# EasyEDA Pro project 电脑鼠_数字量最终方案.eprj, schematic 底盘
Create Date: 2025-09-23; Page Name: P1; Project Name: 电脑鼠SYR; Schematic Name: 底盘; Update Date: 2025-10-16; Company: 苏州大学电子信息学院; Drawed: 石殷睿; Page Size: A4; Version: V1.0
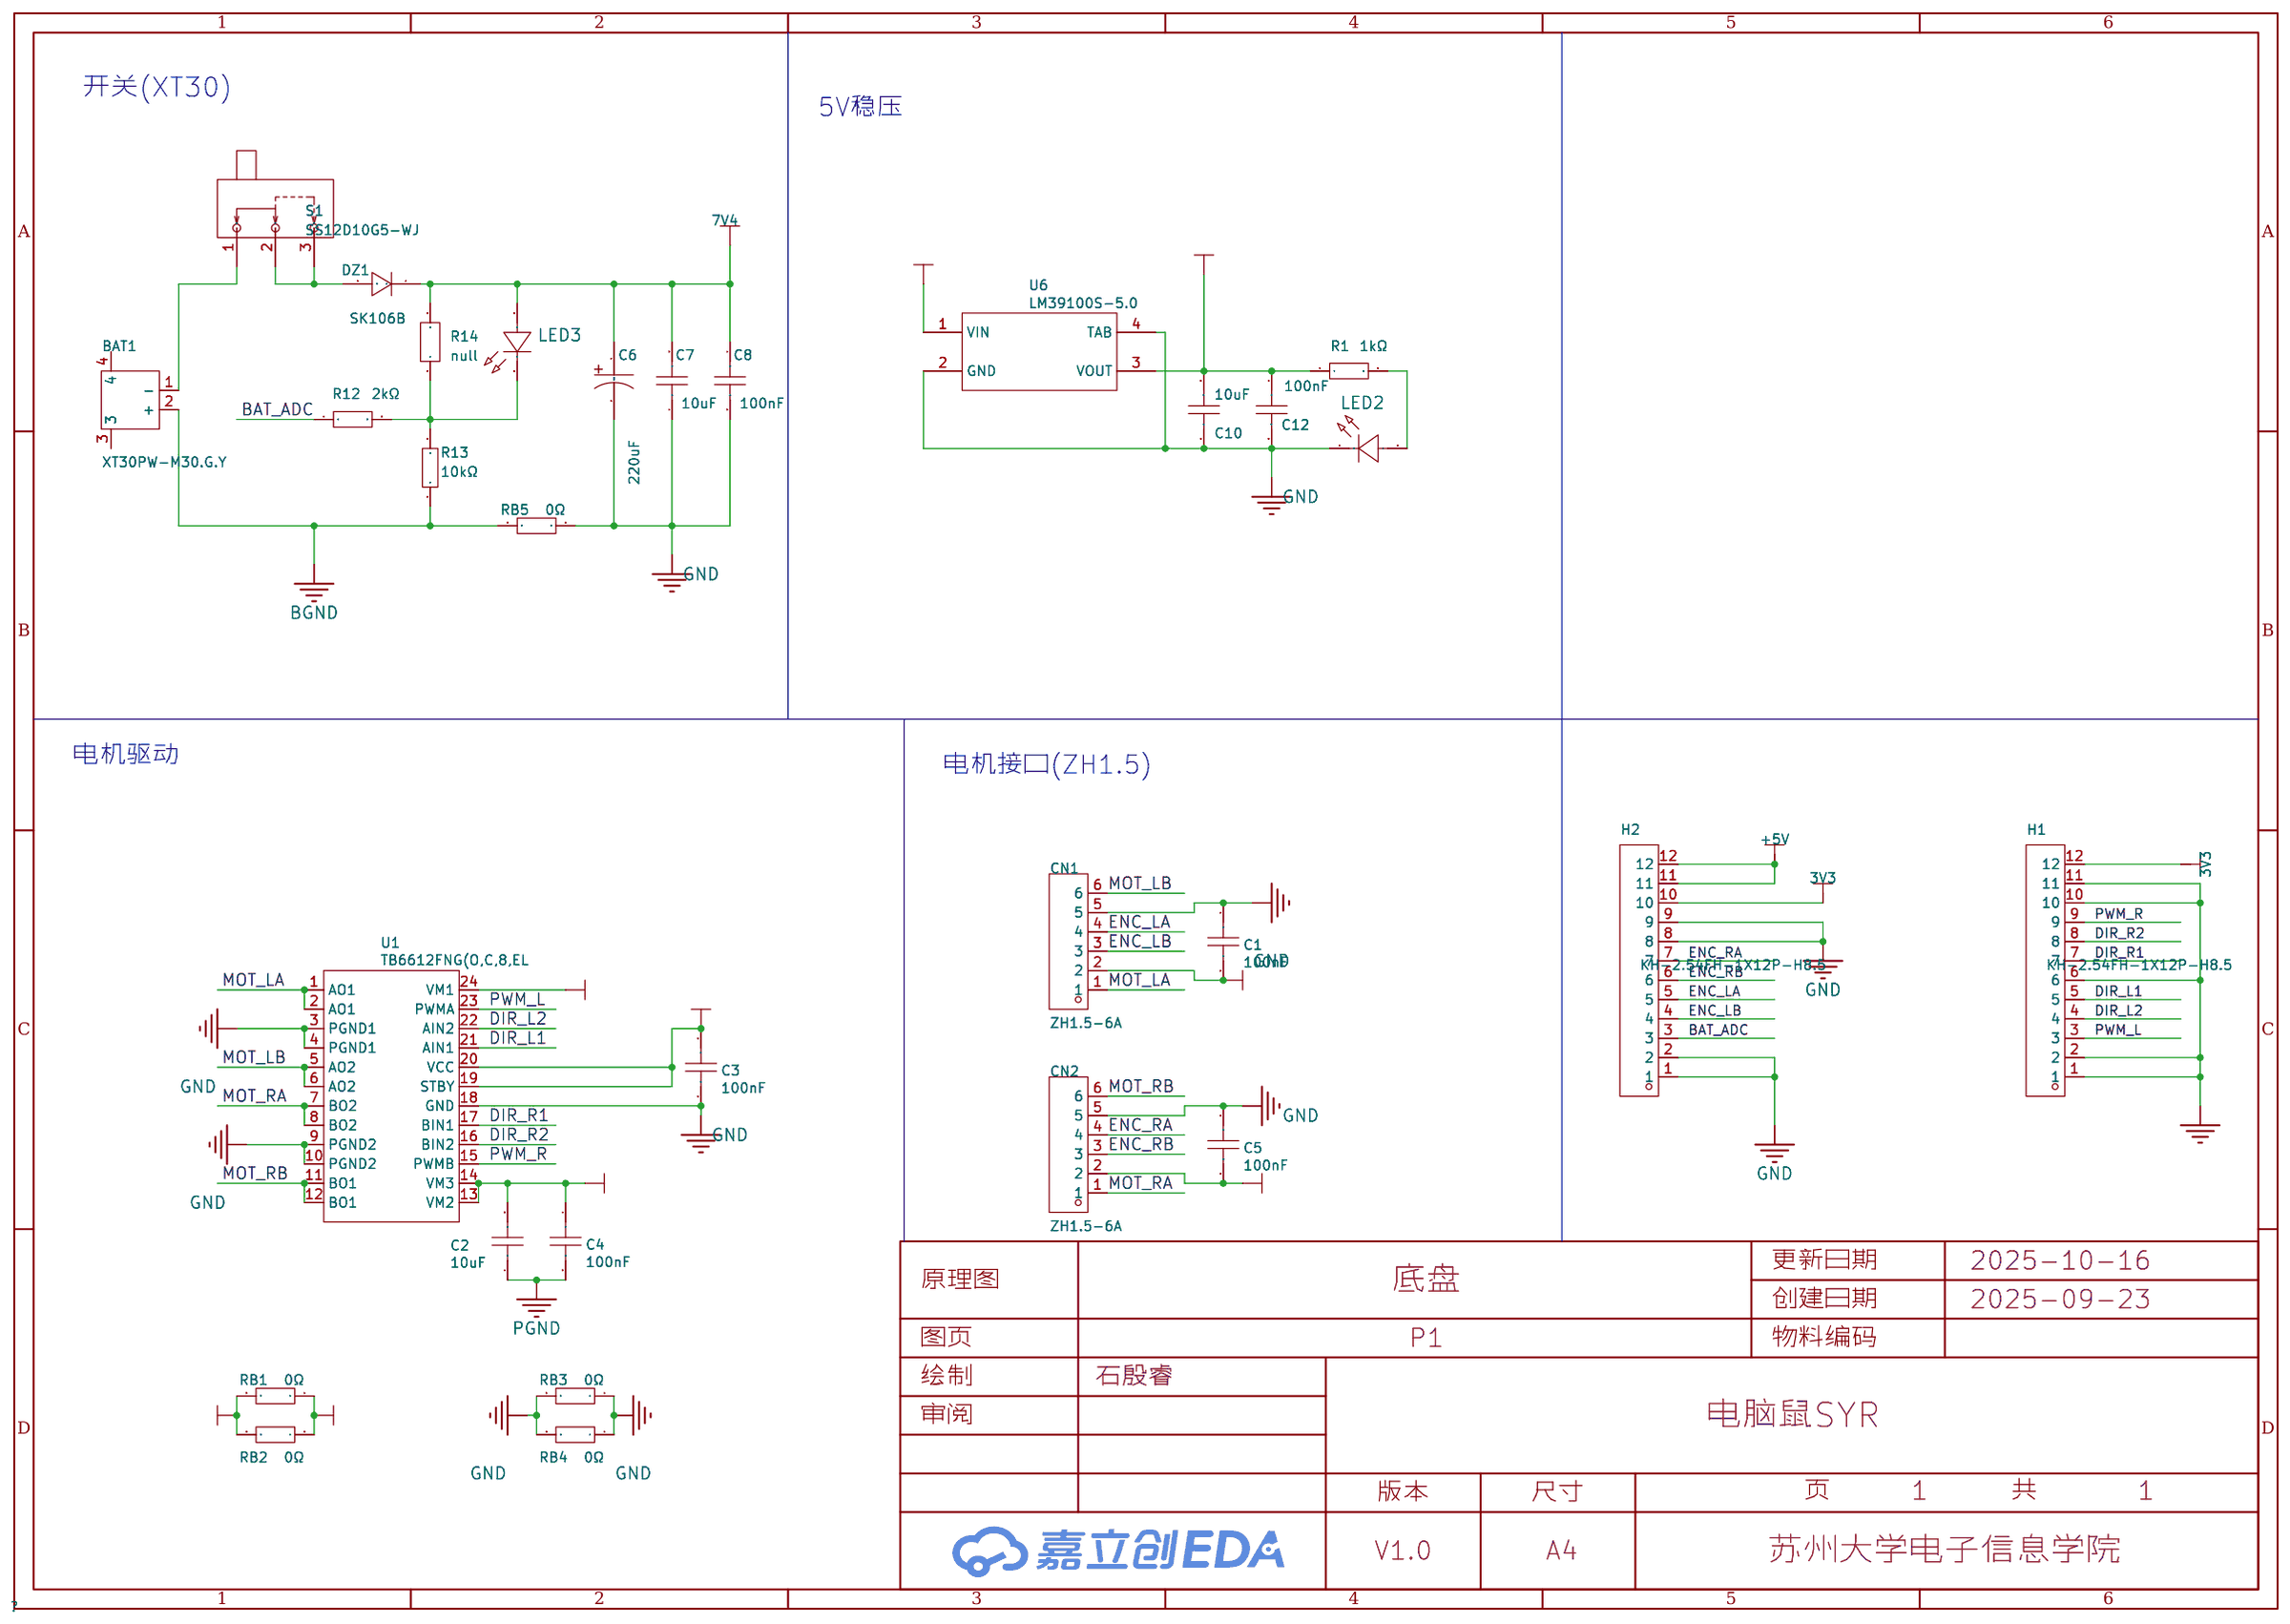
[diagram p1: schematic sheet]

## Parts
BAT1  XT30PW-M30.G.Y  [CONN-TH_XT30PW-M]
C1  100nF  [C0603]
C2  10uF  [C1206]
C3  100nF  [C0603]
C4  100nF  [C0603]
C5  100nF  [C0603]
C6  220uF  [CAP-TH_BD8.0-P3.50-D0.6-FD]
C7  10uF  [C1206]
C8  100nF  [C0603]
C10  10uF  [C1206]
C12  100nF  [C0603]
CN1  ZH1.5-6A  [CONN-TH_ZH1.5-6A]
CN2  ZH1.5-6A  [CONN-TH_ZH1.5-6A]
DZ1  SK106B  [SMB_L4.5-W3.7-LS5.4-RD]
H1  KH-2.54FH-1X12P-H8.5  [HDR-TH_12P-P2.54-V-F]
H2  KH-2.54FH-1X12P-H8.5  [HDR-TH_12P-P2.54-V-F]
LED2  XL-1608SURC-06  [LED0603-RD_RED]
LED3  XL-1608SURC-06  [LED0603-RD_RED]
R1  1kΩ  [R0603]
R12  2kΩ  [R0603]
R13  10kΩ  [R0603]
R14  null  [R0603]
RB1  0Ω  [R0603]
RB2  0Ω  [R0603]
RB3  0Ω  [R0603]
RB4  0Ω  [R0603]
RB5  0Ω  [R0603]
S1  SS12D10G5-WJ  [SW-TH_3P-SS12D06-1]
U1  TB6612FNG(O,C,8,EL  [SSOP-24_L8.4-W5.8-P0.65-LS7.8-BL]
U6  LM39100S-5.0  [SOT-223-3_L6.5-W3.4-P2.30-LS7.0-BR]

## Library data of the parts
BAT1 = XT30PW-M30.G.Y: 类别:-;类型1:-;; LCSC Part Name: AMASS(艾迈斯)航模插头 卧式弯脚 XT30PW-M公头; Supplier Part: C431092; Manufacturer: AMASS(艾迈斯); JLCPCB Part Class: Extended Part; Datasheet: https://item.szlcsc.com/datasheet/XT30PW-M30.G.Y/426930.html; Supplier: LCSC; Type: 航模插头; RatedVoltage: DC 500V; InterfaceType: 公头; RatedCurrent: 15A; RecommendedWireGauge: 16/18/20AWG; contact resistance: 1.2mΩ; specifications: 2pin
C1 C3-C5 C8 C12 = CC0603KRX7R9BB104: 容值:100nF;精度:±10%;额定电压:50V;温度系数:X7R;; LCSC Part Name: 100nF ±10% 50V; Supplier Part: C14663; Manufacturer: YAGEO(国巨); Supplier Footprint: 0603; JLCPCB Part Class: Basic Part; Datasheet: https://item.szlcsc.com/datasheet/CC0603KRX7R9BB104/15331.html; Supplier: LCSC; Tolerance: ±10%; Voltage Rated: 50V; Temperature Coefficient: X7R; Voltage Rating: 50V
C2 C7 C10 = CL31A106KBHNNNE: 容值:10uF;精度:±10%;额定电压:50V;温度系数:X5R;; LCSC Part Name: 10uF ±10% 50V; Supplier Part: C13585; Manufacturer: SAMSUNG(三星); Supplier Footprint: 1206; JLCPCB Part Class: Basic Part; Datasheet: https://item.szlcsc.com/datasheet/CL31A106KBHNNNE/14236.html; Supplier: LCSC; Tolerance: ±10%; Voltage Rating: 50V; Temperature Coefficient: X5R; link: https://so.szlcsc.com/global.html?k=C3897871&amp;ref=editor
C6 = GR227M025F12RR0VH4FP0: 容值:220uF;精度:±20%;额定电压:25V;; LCSC Part Name: 220uF ±20% 25V; Supplier Part: C114911; Manufacturer: Chengx(承兴); Supplier Footprint: 插件,D8xL12mm; JLCPCB Part Class: Extended Part; Datasheet: https://item.szlcsc.com/datasheet/GR227M025F12RR0VH4FP0/116155.html; Supplier: LCSC; Tolerance: ±20%; Rated Voltage: 25V; Lead Spacing: 3.5mm; φD: 8mm; L: 12mm; Operating Temperature: -40℃~+105℃; Voltage Rating: 25V; Pin Spacing: 3.5mm; Diameter: 8mm; Height - Seated (Max): 12mm
CN1 CN2 = ZH1.5-6A: 插针结构:1x6P;间距:1.5mm;安装方式:直插;参考系列:ZH;总PIN数:6P;排数:1;每排PIN数:6;行距:-;额定电流:1A;工作温度:-25℃~+85℃;; LCSC Part Name: 1x6P 间距:1.5mm 直插 系列:ZH; Supplier Part: C722926; Manufacturer: CAX(创都); Supplier Footprint: 插件,P=1.5mm; JLCPCB Part Class: Extended Part; Datasheet: https://item.szlcsc.com/datasheet/ZH1.5-6A/767133.html; Supplier: LCSC; Pins Structure: 1x6P; Pitch: 1.5mm; Mounting Style: 直插; Reference Series: ZH; Number of Pins: 6P; Number of Rows: 1; Number of PINs Per Row: 6; Current Rating (Max): 1A; Operating Temperature Range: -25℃~+85℃; Mounting Type: 直插; Current Rating: 1A; Operating Temperature: -25℃~+85℃
DZ1 = SK106B_C28646301: 二极管配置:独立式;正向压降(Vf):700mV@10A;直流反向耐压(Vr):60V;整流电流:10A;; LCSC Part Name: 电压:60V 电流:10A; Supplier Part: C28646301; Manufacturer: R+O(宏嘉诚); Supplier Footprint: SMB; JLCPCB Part Class: Extended Part; Datasheet: https://item.szlcsc.com/datasheet/SK106B/30381047.html; Supplier: LCSC; Diode Configuration: 独立式; Voltage - Forward(Vf@If): 700mV@10A; Voltage - DC Reverse(Vr): 60V; Current - Rectified: 10A; Reverse Leakage Current (Ir): 100uA@60V; Forward Voltage (Vf@If): 650mV@10A; Reverse Voltage (Vr): 60V; Rectified Current: 10A
H1 H2 = KH-2.54FH-1X12P-H8.5: 插孔结构:1x12P;间距:2.54mm;行距:-;圆孔/方孔:方孔;安装方式:直插;排数:单排;总孔位数:12P;额定电流:3A;额定电压:-;插孔方向:顶部;塑高:8.5mm;工作温度:-40℃~+105℃;; LCSC Part Name: 间距:2.54mm 1x12P 直插; Supplier Part: C2905419; Manufacturer: kinghelm(金航标); Supplier Footprint: 插件,P=2.54mm; JLCPCB Part Class: Extended Part; Datasheet: https://item.szlcsc.com/datasheet/KH-2.54FH-1X12P-H8.5/3175193.html; Supplier: LCSC; Holes Structure: 1x12P; Pitch: 2.54mm; Circular Hole / Square Hole: 方孔; Mounting Type: 直插; Number of Rows: 单排; Number of Holes: 12P; Current Rating (Max): 3A; Holes Direction: 顶部; Insulation Height: 8.5mm; Operating Temperature Range: -40℃~+105℃; Number of Positions: 12P; Current Rating: 3A; Operating Temperature: -40℃~+105℃
LED2 LED3 = XL-1608SURC-06: 灯头类型:-;发光颜色:红色;正向压降(Vf):2.3V;功率:50mW;正向电流:20mA;波长:620nm~630nm;二极管配置:-;透镜颜色:无色透明透镜;色温:-;发光强度:225mcd;发光角度:120°;载带方式:正贴;工作温度:-40℃~+85℃;; LCSC Part Name: 0603红色贴片式发光二极管; Supplier Part: C965799; Manufacturer: XINGLIGHT(成兴光); Supplier Footprint: 0603; JLCPCB Part Class: Extended Part; Datasheet: https://item.szlcsc.com/datasheet/XL-1608SURC-06/1051408.html; Supplier: LCSC; Emitted Color: 红色; Power Dissipation: 55mW; Forward Current: 20mA; Dominant Wavelength: 617nm~621nm; Peak Wavelength: 625nm; Lens Color: 无色透明透镜; Viewing Angle: 120°; Mounting Sytle: 正贴; Operating Temperature: -40℃~+85℃; Illumination Color: 红色; Voltage - Forward(Vf): 2.3V; Power(Watts): 50mW; Wavelength - Dominant: 620nm~630nm; Luminous Intensity: 225mcd; Mounting Style: 正贴
R1 = 0603WAF1001T5E: 电阻类型:厚膜电阻;阻值:1kΩ;精度:±1%;功率:100mW;最大工作电压:75V;温度系数:±100ppm/℃;; LCSC Part Name: 1kΩ ±1% 100mW 厚膜电阻; Supplier Part: C21190; Manufacturer: UNI-ROYAL(厚声); Supplier Footprint: 0603; JLCPCB Part Class: Basic Part; Datasheet: https://atta.szlcsc.com/upload/public/pdf/source/20200306/C422600_1E6D84923E4A46A82E41ADD87F860B5C.pdf; Supplier: LCSC; Type: 厚膜电阻; Tolerance: ±1%; Power(Watts): 100mW; Overload Voltage (Max): 75V; Temperature Coefficient: ±100ppm/℃; Operating Temperature Range: -55℃~+155℃
R12 = 0603WAF2001T5E: 电阻类型:厚膜电阻;阻值:2kΩ;精度:±1%;功率:100mW;工作电压:75V;温度系数:±100ppm/℃;; LCSC Part Name: 2kΩ ±1% 100mW 厚膜电阻; Supplier Part: C22975; Manufacturer: UNI-ROYAL(厚声); Supplier Footprint: 0603; JLCPCB Part Class: Basic Part; Datasheet: https://item.szlcsc.com/datasheet/0603WAF2001T5E/23702.html; Supplier: LCSC; Type: 厚膜电阻; Tolerance: ±1%; Power(Watts): 100mW; Overload Voltage (Max): 75V; Temperature Coefficient: ±100ppm/℃; Operating Temperature Range: -55℃~+155℃; Voltage-Supply(Max): 75V; Operating Temperature: -55℃~+155℃
R13 = 0603WAF1002T5E: 电阻类型:厚膜电阻;阻值:10kΩ;精度:±1%;功率:100mW;工作电压:75V;温度系数:±100ppm/℃;; LCSC Part Name: 厚膜电阻 10kΩ ±1% 100mW; Supplier Part: C25804; Manufacturer: UNI-ROYAL(厚声); Supplier Footprint: 0603; JLCPCB Part Class: Basic Part; Datasheet: https://item.szlcsc.com/datasheet/0603WAF1002T5E/26547.html; Supplier: LCSC; Type: 厚膜电阻; Tolerance: ±1%; Power(Watts): 100mW; Overload Voltage (Max): 75V; Temperature Coefficient: ±100ppm/℃; Operating Temperature Range: -55℃~+155℃; Voltage-Supply(Max): 75V; Operating Temperature: -55℃~+155℃
R14 = 12.5K: Check: false
RB1-RB5 = 0603WAF0000T5E: 电阻类型:厚膜电阻;阻值:0Ω;精度:±1%;功率:100mW;工作电压:75V;温度系数:-;; LCSC Part Name: 0Ω ±1% 100mW 厚膜电阻; Supplier Part: C21189; Manufacturer: UNI-ROYAL(厚声); Supplier Footprint: 0603; JLCPCB Part Class: Basic Part; Datasheet: https://item.szlcsc.com/datasheet/0603WAF0000T5E/21903.html; Supplier: LCSC; Type: 厚膜电阻; Tolerance: ±1%; Power(Watts): 100mW; Overload Voltage (Max): 75V; Operating Temperature Range: -55℃~+155℃; Voltage-Supply(Max): 75V; Operating Temperature: -55℃~+155℃
S1 = SS12D10G5-WJ: 电路结构:单刀双掷;安装方式:直插;额定电流(DC):2A;额定电压(DC):125V;机械寿命:3千次;; LCSC Part Name: 两档卧式插件 3脚拨动开关弯插 柄长5.0mm; Supplier Part: C7431058; Manufacturer: SHOU HAN(首韩); Supplier Footprint: 插件; JLCPCB Part Class: Extended Part; Datasheet: https://atta.szlcsc.com/upload/public/pdf/source/20230621/24203FB22DE8BDD2A5BD75F3B5E716C8.pdf; Supplier: LCSC; Circuit: 单刀双掷; Switch Length: 12.7mm; Switch Width: 6.7mm; Mounting Style: 直插; Current Rating (DC): 2A; Voltage Rating (DC): 125V; Mechanical Life: 3千次; Operating Temperature: -25℃~+70℃
U1 = TB6612FNG(O,C,8,EL: 双直流电机驱动器集成电路; Supplier Part: C88224; Manufacturer: TOSHIBA(东芝); Supplier Footprint: SSOP-24-208mil; JLCPCB Part Class: Extended Part; Datasheet: https://item.szlcsc.com/datasheet/TB6612FNG(O%252CC%252C8%252CEL/89402.html; Supplier: LCSC; RDS(on): 500mΩ; Peak Current: 3.2A; Operating Temperature: -20℃~+85℃; link: https://so.szlcsc.com/global.html?k=C88224&amp;ref=editor
U6 = LM39100S-5.0: 输出类型:固定;工作电压:16V;输出电压:5V;输出电流:1A;电源纹波抑制比(PSRR):-;输出极性:正极;; LCSC Part Name: 输入16V 输出5V 1A; Supplier Part: C126056; Manufacturer: HTC; Supplier Footprint: SOT-223; JLCPCB Part Class: Extended Part; Datasheet: https://item.szlcsc.com/datasheet/LM39100S-5.0/137336.html; Supplier: LCSC; Output Type: 固定; Voltage - Supply: 16V; Output Voltage: 5V; Output Current: 1A; Voltage Dropout: 630mV; standby current: 7mA; Features: 过流保护；带使能；过热保护; Operating Temperature: -40℃~+125℃@(Tj); Output Configuration: 正极; Number of Outputs: 1; link: https://so.szlcsc.com/global.html?k=C126056&amp;ref=editor

## Nets
3V3: H1.12 H2.10
7V4: C6.1 C7.2 C8.1 DZ1.1 LED3.2(A) R14.2 RB1.2 RB2.2 U6.1(VIN)
+5V: C1.2 C3.1 C5.2 C10.2 C12.1 CN1.2 CN2.2 H2.11 H2.12 R1.1 U1.19(STBY) U1.20(VCC) U6.3(VOUT)
GND: C1.1 C3.2 C5.1 C6.2 C7.1 C8.2 C10.1 C12.2 CN1.5 CN2.5 H1.1 H1.2 H1.6 H1.10 H1.11 H2.1 H2.2 H2.8 H2.9 LED2.1(K) RB5.1 U1.3(PGND1) U1.4(PGND1) U1.9(PGND2) U1.10(PGND2) U1.18(GND) U6.2(GND) U6.4(TAB)
PGND: C2.1 C4.2
BAT_ADC: H2.3 R12.1
BGND: BAT1.2(+) R13.1 RB5.2
DIR_L1: H1.5 U1.21(AIN1)
DIR_L2: H1.4 U1.22(AIN2)
DIR_R1: H1.7 U1.17(BIN1)
DIR_R2: H1.8 U1.16(BIN2)
ENC_LA: CN1.4 H2.5
ENC_LB: CN1.3 H2.4
ENC_RA: CN2.4 H2.7
ENC_RB: CN2.3 H2.6
MOT_LA: CN1.1 U1.1(AO1) U1.2(AO1)
MOT_LB: CN1.6 U1.5(AO2) U1.6(AO2)
MOT_RA: CN2.1 U1.7(BO2) U1.8(BO2)
MOT_RB: CN2.6 U1.11(BO1) U1.12(BO1)
PBAT: C2.2 C4.1 RB1.1 RB2.1 U1.13(VM2) U1.14(VM3) U1.24(VM1)
PWM_L: H1.3 U1.23(PWMA)
PWM_R: H1.9 U1.15(PWMB)
$1N1564: LED3.1(K) R12.2 R13.2 R14.1
$1N1618: LED2.2(A) R1.2
$1N1647: DZ1.2 S1.2 S1.3
Net-(BAT1-1): BAT1.1(-) S1.1

Not connected (* = marked no-connect by the designer): BAT1 3 4; RB3 1 2; RB4 1 2

## Notes on the sheet
- 开关(XT30)
- 5V稳压
- 电机驱动
- 电机接口(ZH1.5)
